# Altium schematic sheet Child.SchDoc
size A4
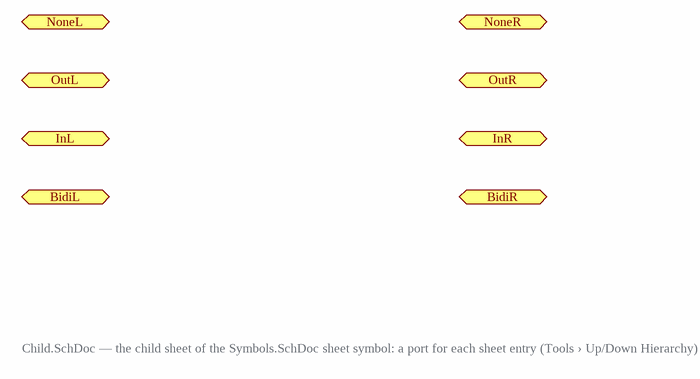
[diagram p0: Child.SchDoc]

## Ports
BidiL (bidir), BidiR (bidir), InL (in), InR (in), NoneL, NoneR, OutL (out), OutR (out)

## Notes on the sheet
- Child.SchDoc — the child sheet of the Symbols.SchDoc sheet symbol: a port for each sheet entry (Tools › Up/Down Hierarchy)